# Altium schematic sheet Sensing.SchDoc
size A4; SheetNumber: 5; SheetTotal: 7
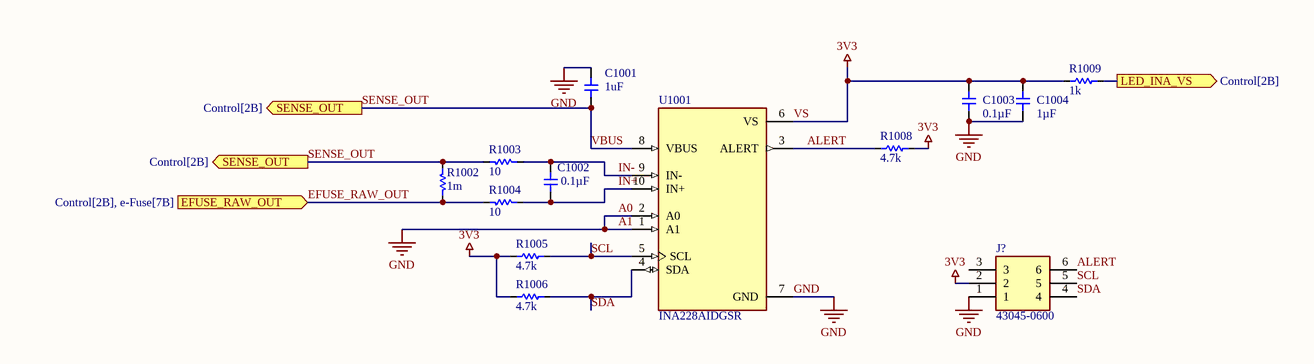
[diagram p0: Sensing.SchDoc]

## Parts
C1001  Capacitance: 1uF  [C1210]  (hidden comment: C_1210_1UF_10P_100V_X7R)
C1002  Capacitance: 0.1µF  [C0603]  (hidden comment: C_0603_0P1UF_10P_100V_X7R)
C1003  Capacitance: 0.1µF  [C0603]  (hidden comment: C_0603_0P1UF_10P_100V_X7R)
C1004  Capacitance: 1µF  [C0603]  (hidden comment: C_0603_1UF_10P_25V_X7R)
J?  43045-0600  [43045-06(00,01,02,10)]
R1002  Resistance: 1m  [R2512]  (hidden comment: R_2512_1R_1P_5W)
R1003  Resistance: 10  [R0603]  (hidden comment: R_0603_10R_1P_0P1W)
R1004  Resistance: 10  [R0603]  (hidden comment: R_0603_10R_1P_0P1W)
R1005  Resistance: 4.7k  [R0603]  (hidden comment: R_0603_4K7_1P_0P1W)
R1006  Resistance: 4.7k  [R0603]  (hidden comment: R_0603_4K7_1P_0P1W)
R1008  Resistance: 4.7k  [R0603]  (hidden comment: R_0603_4K7_1P_0P1W)
R1009  Resistance: 1k  [R0603]  (hidden comment: R_0603_1K_1P_0P1W)
U1001  INA228AIDGSR  [SOP50P490X110-10N]

## Ports
EFUSE_RAW_OUT (in, see Control[2B], e-Fuse[7B]), LED_INA_VS (out, see Control[2B]), SENSE_OUT (out, see Control[2B])

## Nets
\: C1001.2 C1003.1 C1004.1 J?.1 U1001.1(A1) U1001.2(A0) U1001.7(GND)  [also labelled A0, A1, GND]
VS: C1003.2 C1004.2 J?.2 R1005.1 R1006.1 R1008.2 R1009.2 U1001.6(VS)  [also labelled 3V3]
ALERT: J?.6 R1008.1 U1001.3(ALERT)
EFUSE_RAW_OUT: R1002.1 R1004.2 ; port EFUSE_RAW_OUT
IN+: C1002.1 R1004.1 U1001.10(IN+)
IN-: C1002.2 R1003.1 U1001.9(IN-)
LED_INA_VS: R1009.1 ; port LED_INA_VS
SCL: J?.5 R1005.2 U1001.5(SCL)
SDA: J?.4 R1006.2 U1001.4(SDA)
SENSE_OUT: C1001.1 R1002.2 R1003.2 U1001.8(VBUS) ; port SENSE_OUT  [also labelled VBUS]

Not connected (* = marked no-connect by the designer): J? 3

## Library data of the parts
C1001 = CMP-00023-3: MLCC, 1µF, 10%, 100V, X7R, 0603; Voltage Rating: 100V; Mounting Type: SMD; Package: 1210; Tolerance: 10%; Dielectric: X7R
C1002 C1003 = CMP-00021-3: MLCC, 0.1µF, 10%, 100V, X7R, 0603; Dielectric: X7R; Mounting Type: SMD; Tolerance: 10%; Package: 0603; Voltage Rating: 100V
C1004 = CMP-00025-2: MLCC, 1µF, 10%, 25V, X7R, 0603; Dielectric: X7R; Tolerance: 10%; Voltage Rating: 25V; Package: 0603; Mounting Type: SMD
J? = 43045-0600: Connector; Manufacturer_Name: Molex; Datasheet Link: https://www.molex.com/pdm_docs/sd/430450200_sd.pdf; Height: 9.9mm; Manufacturer_Part_Number: 43045-0600; Mouser Part Number: 538-43045-0600; Mouser Price/Stock: https://www.mouser.co.uk/ProductDetail/Molex/43045-0600?qs=mrPiglD9aYJ8CzJ%2FE2PNbw%3D%3D; Arrow Part Number: 43045-0600; Arrow Price/Stock: https://www.arrow.com/en/products/43045-0600/molex?region=nac
R1002 = CMP-00015-10: Chip resistor, 1m Ohm, ±1%, 5W, 2512; Package: 2512; Power Rating: 5W; Tolerance: 1%; Mounting Type: SMD
R1003 R1004 = CMP-00010-8: Chip resistor, 10 Ohm, 1%, 0.1W, 0603; Voltage Rating: 50V; Power Rating: 100mW; Mounting Type: SMD; Package: 0603; Tolerance: 1%
R1005 R1006 R1008 = CMP-00011-6: Chip resistor, 4.7k Ohm, 1%, 0.1W, 0603; Power Rating: 100mW; Voltage Rating: 75V; Tolerance: 1%; Package: 0603; Mounting Type: SMD
R1009 = CMP-00012-6: Chip resistor, 1k Ohm, 1%, 0.1W, 0603; Power Rating: 100mW; Voltage Rating: 50V; Mounting Type: SMD; Package: 0603; Tolerance: 1%
U1001 = CMP-303-000000-1: 85-V, 20-bit, ultra-precise, I2C output current/voltage/power/energy/charge monitor with alert; MF: Texas Instruments; Pin Count: 10; Check_prices: https://www.snapeda.com/parts/INA228AIDGSR/Texas+Instruments/view-part/?ref=eda; SnapEDA_Link: https://www.snapeda.com/parts/INA228AIDGSR/Texas+Instruments/view-part/?ref=snap; Source: INA228AIDGSR.SchLib; Component Type: Standard; Value: *; Design Item ID: INA228AIDGSR; MP: INA228AIDGSR; Package: VSSOP-10 Texas Instruments